# Altium project Control-Board-v1.0.PrjPcb (part 4 of 7)

## Sheet TFT_Display_Sheet.SchDoc
size 420 x 297 mm; SheetNumber: 6; SheetTotal: 9
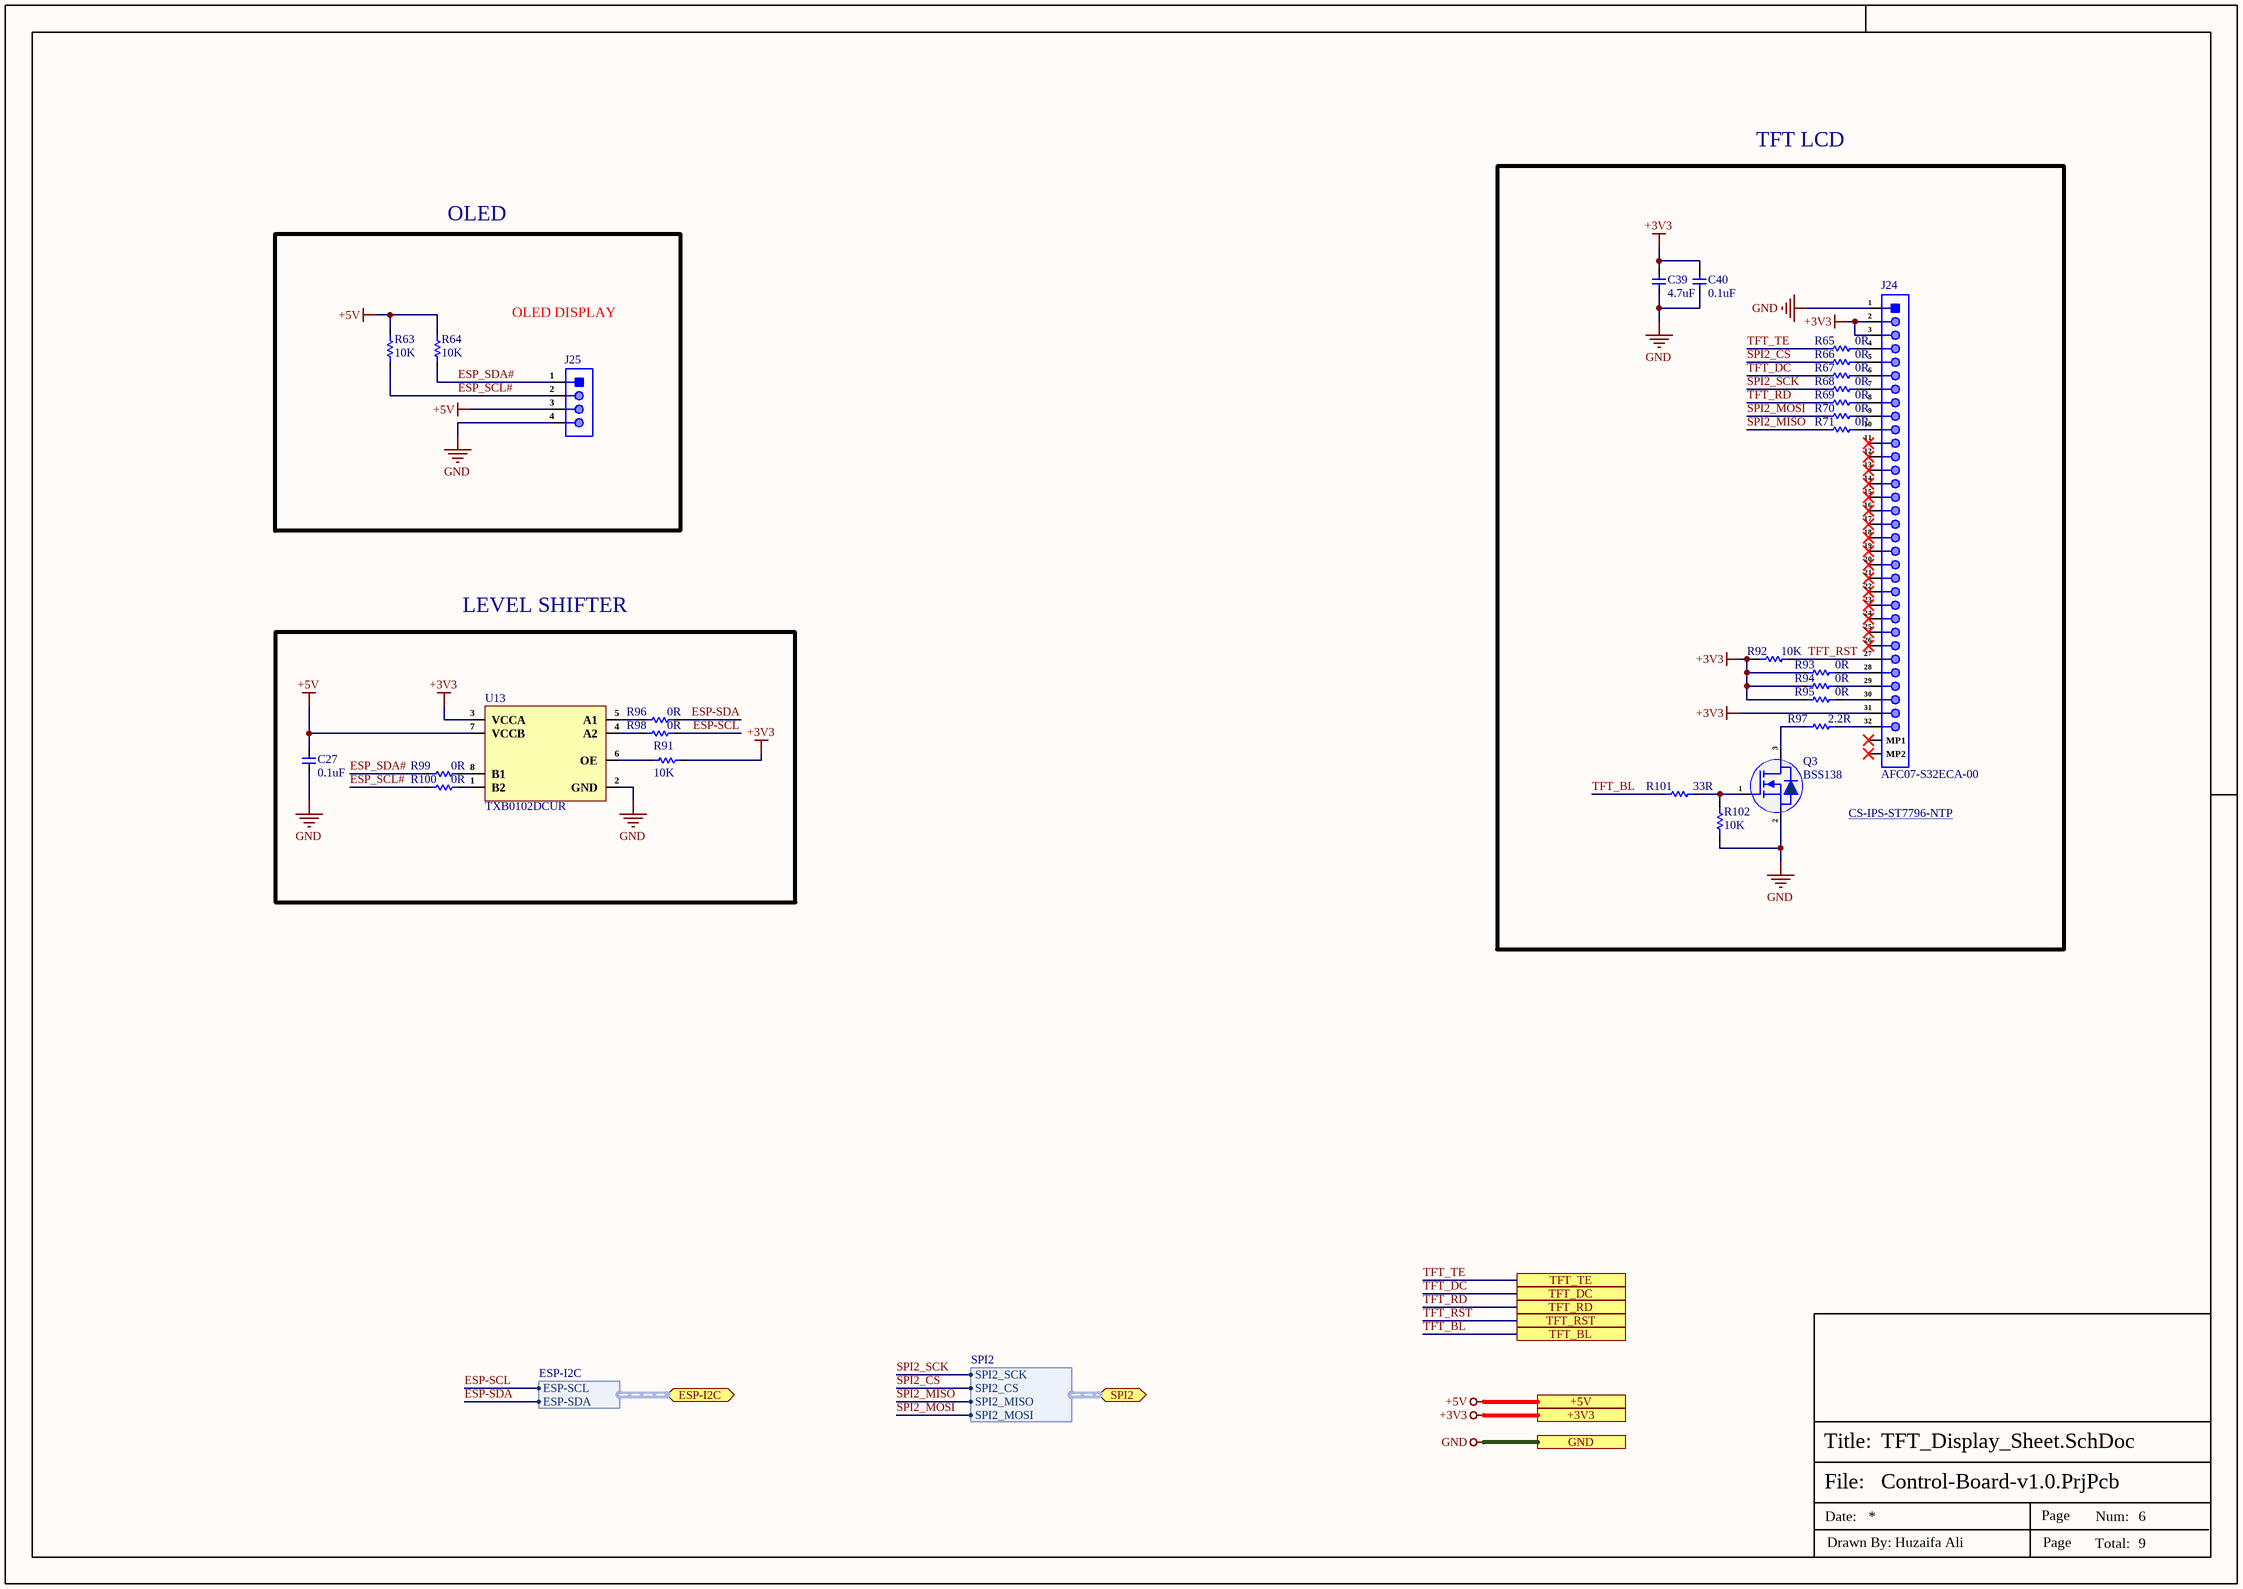
[diagram p5: TFT_Display_Sheet.SchDoc]

### Parts
C27  0.1uF  [Cap-0402]
C39  4.7uF  [Cap-0603]
C40  0.1uF  [Cap-0402]
J24  AFC07-S32ECA-00  [AFC07-S32ECA-00]
J25  B4B-XH-A(LF)(SN)  [B4B-XH-A(LF)(SN).]  (value not drawn)
Q3  BSS138  [Sot-23]
R63  10K  [Res-0402]
R64  10K  [Res-0402]
R65  0R  [Res-0402]
R66  0R  [Res-0402]
R67  0R  [Res-0402]
R68  0R  [Res-0402]
R69  0R  [Res-0402]
R70  0R  [Res-0402]
R71  0R  [Res-0402]
R91  10K  [Res-0402]
R92  10K  [Res-0402]
R93  0R  [Res-0402]
R94  0R  [Res-0402]
R95  0R  [Res-0402]
R96  0R  [Res-0402]
R97  2.2R  [Res-0603]
R98  0R  [Res-0402]
R99  0R  [Res-0402]
R100  0R  [Res-0402]
R101  33R  [Res-0402]
R102  10K  [Res-0402]
U13  TXB0102DCUR  [VSSOP-8(3.1x2.1)]

### Blocks framed on the sheet
CS-IPS-ST7796-NTP: C39 C40 J24 Q3 R65-R71 R92-R95 R97 R101 R102
OLED DISPLAY: J25 R63 R64

### Ports
+3V3 (see Top-Sheet[2B], CAN_Sheet[5D], ESP32_Sheet[5D], EtherCAT_Sheet[5D], Ethernet_Sheet[5D], Power_Sheet[5D], RS485_RS232_Sheet[5D], STM32_Sheet[5D]), +5V (see Top-Sheet[2B], CAN_Sheet[5D], Power_Sheet[5D], STM32_Sheet[5D]), ESP-I2C (bidir, harness ESP-I2C, see Top-Sheet[2B], ESP32_Sheet[4D]), GND (see Top-Sheet[2B], CAN_Sheet[5D], ESP32_Sheet[5D], EtherCAT_Sheet[5D], Ethernet_Sheet[5D], Power_Sheet[5D], RS485_RS232_Sheet[5D], STM32_Sheet[5D]), SPI2 (bidir, harness SPI2, see Top-Sheet[2B], STM32_Sheet[1C]), TFT_BL (see Top-Sheet[2C], STM32_Sheet[3D]), TFT_DC (see Top-Sheet[2C], STM32_Sheet[4D]), TFT_RD (see Top-Sheet[2C], STM32_Sheet[4D]), TFT_RST (see Top-Sheet[2C], STM32_Sheet[4D]), TFT_TE (see Top-Sheet[2B], STM32_Sheet[4D])

### Harnesses
ESP-I2C: ESP-SCL, ESP-SDA
SPI2: SPI2_SCK, SPI2_CS, SPI2_MISO, SPI2_MOSI

### Nets
+3V3: C39.2 C40.2 J24.2 J24.3 J24.31 R91.2 R92.2 R93.1 R94.1 R95.1 U13.3(VCCA) ; port +3V3
+5V: C27.2 J25.3 R63.2 R64.2 U13.7(VCCB) ; port +5V
GND: C27.1 C39.1 C40.1 J24.1 J25.4 Q3.2(S) R102.2 U13.2(GND) ; port GND
ESP-SCL: R98.2 ; port ESP-I2C.ESP-SCL
ESP-SDA: R96.2 ; port ESP-I2C.ESP-SDA
ESP_SCL#: J25.2 R63.1 R100.1
ESP_SDA#: J25.1 R64.1 R99.1
SPI2_CS: R66.1 ; port SPI2.SPI2_CS
SPI2_MISO: R71.1 ; port SPI2.SPI2_MISO
SPI2_MOSI: R70.1 ; port SPI2.SPI2_MOSI
SPI2_SCK: R68.1 ; port SPI2.SPI2_SCK
TFT_BL: R101.1 ; port TFT_BL
TFT_DC: R67.1 ; port TFT_DC
TFT_RD: R69.1 ; port TFT_RD
TFT_RST: J24.27 R92.1 ; port TFT_RST
TFT_TE: R65.1 ; port TFT_TE
NetJ24_4: J24.4 R65.2
NetJ24_5: J24.5 R66.2
NetJ24_6: J24.6 R67.2
NetJ24_7: J24.7 R68.2
NetJ24_8: J24.8 R69.2
NetJ24_9: J24.9 R70.2
NetJ24_10: J24.10 R71.2
NetJ24_28: J24.28 R93.2
NetJ24_29: J24.29 R94.2
NetJ24_30: J24.30 R95.2
NetJ24_32: J24.32 R97.2
NetQ3_1: Q3.1(G) R101.2 R102.1
NetQ3_3: Q3.3(D) R97.1
NetR91_1: R91.1 U13.6(OE)
NetR96_1: R96.1 U13.5(A1)
NetR98_1: R98.1 U13.4(A2)
NetR99_2: R99.2 U13.8(B1)
NetR100_2: R100.2 U13.1(B2)

Not connected (* = marked no-connect by the designer): J24 11* 12* 13* 14* 15* 16* 17* 18* 19* 20* 21* 22* 23* 24* 25* 26* MP1* MP2*

### Notes on the sheet
- TFT LCD
- OLED
- LEVEL SHIFTER
- File:
- Title:
- Date:
- Page
- Num:
- Total:
- Drawn By: Huzaifa Ali

### Library data of the parts
C27 = C1005X5R1H104K050BB: CAP CER 0.1UF 50V X5R 0402; Manufacturer: TDK; Dielectric Material: Ceramic; Capacitance: 100nF; Tolerance: 10%; Item Type: Capacitor; Supplier 1: Digi-Key; Manufacturer Part Number: C1005X5R1H104K050BB; Stock 1: 1455182; Pricing 1: 1=0.12, 10=0.09, 50=0.049, 100=0.04, 500=0.02858, 1000=0.02245, 2500=0.02041, 5000=0.01878 (USD); Mount: Surface Mount; Case/Package: 0402; Case Code (Metric): 1005; Case Code (Imperial): 0402; Weight: 2.3E-05oz; Min Operating Temperature: -55°C; Max Operating Temperature: 85°C; Dielectric: X5R; Voltage Rating: 50V; Packaging: Tape and Reel; Voltage Rating (DC): 50V; Termination: SMD/SMT; Construction: Flat; Package Quantity: 1; Resistor Type: Ceramic; Voltage: 50V; Series: C; Length: 1mm; Width: 0.02inch; Height: 0.5mm; Depth: 0.5mm; Thickness: 0.022inch; Radiation Hardening: No; Lead Free: Lead Free; REACH SVHC: No SVHC; RoHS Compliant: Yes; ComponentLink1URL: https://product.tdk.com/info/en/catalog/spec/mlccspec_commercial_general_midvoltage_en.pdf?src-supplier=Digi-Key; ComponentLink1Description: https://product.tdk.com/info/en/catalog/spec/mlccspec_commercial_general_midvoltage_en.pdf?src-supplier=Digi-Key; ComponentLink2URL: http://www.tdk.co.jp/tefe02/e413_c.pdf?src-supplier=Future+Electronics; ComponentLink2Description: http://www.tdk.co.jp/tefe02/e413_c.pdf?src-supplier=Future+Electronics; ComponentLink3URL: https://www.verical.com/server-webapp/html/getDatasheet?partID=743571&src-supplier=Verical; ComponentLink3Description: https://www.verical.com/server-webapp/html/getDatasheet?partID=743571&src-supplier=Verical; ComponentLink4URL: http://www.tdk.co.jp/tefe02/e412_c.pdf?src-supplier=Avnet+Europe; ComponentLink4Description: http://www.tdk.co.jp/tefe02/e412_c.pdf?src-supplier=Avnet+Europe; Supplier Part Number 1: 445-5942-1-ND; LCSC Part Number: C2181865
C39 = CC0603KRX5R7BB475: CAP CER 4.7UF 16V X5R 0603; Manufacturer: Yageo; Tolerance: 10%; Item Type: Capacitor; Supplier 1: Digi-Key; Manufacturer Part Number: CC0603KRX5R7BB475; RoHS: Yes; Category: Ceramic Capacitors; Stock 1: 547703; Pricing 1: 1=0.20000, 10=0.13800, 50=0.08280, 100=0.06990, 500=0.04784, 1000=0.04233 (USD); Mount: Surface Mount; Case/Package: 0603; Case Code (Imperial): 0603; Case Code (Metric): 1608; Weight: 7.1E-05oz; Min Operating Temperature: -55°C; Max Operating Temperature: 85°C; Capacitance: 4.7uF; Voltage Rating: 16V; Voltage Rating (DC): 16V; Packaging: Tape and Reel; Dielectric: X5R; Termination: SMD/SMT; Resistor Type: Ceramic; Series: CC; Length: 1.6mm; Width: 0.8mm; Height: 0.8mm; Thickness: 0.037inch; Depth: 0.8mm; Lead Free: Lead Free; Halogen Free: Halogen Free; RoHS Compliant: Yes; ComponentLink1URL: http://www.mouser.com/ds/2/447/UPY-GPHC_X5R_4V-to-50V_25-1131599.pdf?src-supplier=Mouser; ComponentLink1Description: http://www.mouser.com/ds/2/447/UPY-GPHC_X5R_4V-to-50V_25-1131599.pdf?src-supplier=Mouser; ComponentLink2URL: http://www.yageo.com/documents/recent/UPY-GPHC_X5R_4V-to-50V_25.pdf?src-supplier=Digi-Key; ComponentLink2Description: http://www.yageo.com/documents/recent/UPY-GPHC_X5R_4V-to-50V_25.pdf?src-supplier=Digi-Key; Supplier Part Number 1: 311-1785-1-ND; LCSC Part Number: C277476
C40 = CC0402JRX7R7BB104: CAP CER 0.1UF 16V X7R 0402; Manufacturer: Yageo; Material: 4241ConductorMaterial; Value: 100nF; Tolerance: 5%; Item Type: Capacitor; Supplier: Digikey; Supplier Part Number: 311-1676-1-ND; Manufacturer Part Number: CC0402JRX7R7BB104; RoHS: Yes; Category: Ceramic Capacitors; Stock: 1659111; Pricing: 1=0.1, 10=0.046, 50=0.0262, 100=0.0203, 500=0.01528, 1000=0.012, 2500=0.01091, 5000=0.01004 (USD); Mounting Technology: Surface Mount; Case/Package: 0402; Case Code (Metric): 1005; Case Code (Imperial): 0402; Min Operating Temperature: -55°C; Max Operating Temperature: 125°C; Dielectric: X7R; Packaging: Tape and Reel; Package Quantity: 10000; Voltage Rating (DC): 16V; Voltage Rating: 16V; Series: CC; Construction: Flat; Length: 0.039inch; Width: 0.02inch; Height: 0.5mm; Thickness: 0.022inch; Lead Free: Lead Free; Halogen Free: Halogen Free; RoHS Compliant: Yes; ComponentLink1URL: https://datasheet.ciiva.com/13210/upy-gphc-x7r-6-3v-to-50v-8-12304-13210152.pdf?src-supplier=Mouser; ComponentLink1Description: https://datasheet.ciiva.com/13210/upy-gphc-x7r-6-3v-to-50v-8-12304-13210152.pdf?src-supplier=Mouser; LCSC Part Number: C541464
J24 = AFC07-S32ECA-00: Slide Lock 32P Contact,Top Surface Mount，Right Angle 0.5mm SMD,P=0.5mm,Surface Mount，Right Angle FFC/FPC Connectors ROHS; Manufacturer: JUSHUO; Manufacturer Part Number: AFC07-S32ECA-00; Package: Custom; LCSC Part Number: C262646; Item Type: FFC/FPC Connector; ComponentLink1Description: LCSC; ComponentLink1URL: https://www.lcsc.com/product-detail/FFC-FPC-Connectors_JUSHUO-AFC07-S32ECA-00_C262646.html
J25 = B4B-XH-A(LF)(SN): CONN HEADER VERT 4POS 2.5MM; Manufacturer: JST; Current Rating: 3A; Gender: Male; Contact Resistance: 20mR; Voltage Rating (AC): 250V; Connector Type: Male Pin; Number of Positions: 4; Insulation Resistance: 1GR; Wire/Cable Gauge: 22AWG; Item Type: JST Connector; Supplier 1: Future Electronics; Manufacturer Part Number: B4B-XH-A(LF)(SN); RoHS: Yes; Category: FFC / FPC; Pricing 1: 1=0.13000, 300=0.11300, 1000=0.11000, 3000=0.10700, 10000=0.10400 (USD); Mount: Through Hole; Contact Material: Brass; Material: Polyamide; Contact Plating: Tin,Copper,Lead; Color: Natural; Housing Material: Polyamide; Housing Color: White; Min Operating Temperature: -25°C; Max Operating Temperature: 85°C; Number of Rows: 1; Max Current Rating: 3A; Package Quantity: 500; Packaging: Bulk; Voltage Rating: 250V; Termination: Press-Fit; Max Voltage Rating (AC): 250V; Max Voltage Rating (DC): 250V; Number of Contacts: 4; Orientation: Straight; Length: 12.4mm; Pitch: 2.5mm; Lead Pitch: 2.5mm; Depth: 5.75mm; REACH SVHC: No SVHC; Lead Free: Lead Free; ComponentLink1URL: https://datasheet.ciiva.com/26894/getdatasheetpartid-455616-26894787.pdf?src-supplier=Verical; ComponentLink1Description: https://datasheet.ciiva.com/26894/getdatasheetpartid-455616-26894787.pdf?src-supplier=Verical; ComponentLink2URL: https://datasheet.ciiva.com/26924/getdatasheetpartid-640571-26924035.pdf?src-supplier=Verical; ComponentLink2Description: https://datasheet.ciiva.com/26924/getdatasheetpartid-640571-26924035.pdf?src-supplier=Verical; ComponentLink3URL: https://datasheet.ciiva.com/16203/b4b-xh-alfsn-16203642.pdf?src-supplier=Future+Electronics; ComponentLink3Description: https://datasheet.ciiva.com/16203/b4b-xh-alfsn-16203642.pdf?src-supplier=Future+Electronics; ComponentLink4URL: https://datasheet.ciiva.com/726/exh-726404.pdf?src-supplier=Digi-Key; ComponentLink4Description: https://datasheet.ciiva.com/726/exh-726404.pdf?src-supplier=Digi-Key; Supplier Part Number 1: 8134090; LCSC Part Number: C144395
Q3 = BSS138: 50V 220mA 3.5Ω@10V,220mA 225mW 1.6V@1mA N Channel SOT-23 MOSFETs ROHS; Manufacturer: Slkor(SLKORMICRO Elec.); Item Type: Mosfet; Manufacturer Part Number: BSS138; Package: SOT-23; LCSC Part Number: C426569; ComponentLink1Description: LCSC; ComponentLink1URL: https://www.lcsc.com/product-detail/MOSFETs_Slkor-SLKORMICRO-Elec-BSS138_C426569.html
R63 R64 R91 R92 R102 = RC0402FR-0710KL: RES 10K OHM 1% 1/16W 0402; Manufacturer: Yageo; Resistance: 10kR; Voltage Rating (DC): 50V; Temperature Coefficient: 100ppm/°C; Power Rating: 62.5mW; Max Power Dissipation: 63mW; Item Type: Resistor; Supplier 1: Mouser; Manufacturer Part Number: RC0402FR-0710KL; RoHS: Yes; Category: Chip SMD Resistors; Stock 1: 18648329; Pricing 1: 1=0.10000, 10=0.01400, 50=0.01400, 100=0.00500, 1000=0.00300, 10000=0.00200 (USD); Case/Package: 0402; Number of Pins: 2; Case Code (Imperial): 0402; Case Code (Metric): 1005; Min Operating Temperature: -55°C; Max Operating Temperature: 155°C; Resistor Type: Thick Film; Tolerance: 1%; Packaging: Tape and Reel; Voltage Rating: 50V; Termination: SMD/SMT; Working Voltage: 50V; Number of Terminations: 2; Features: Moisture Resistant; Series: RC; Resistance Tolerance: 1%; Construction: Rectangular; Length: 1mm; Width: 0.5mm; Height: 0.32mm; Depth: 0.5mm; Lead Pitch: 0.2mm; REACH SVHC: No SVHC; Lead Free: Lead Free; RoHS Compliant: Yes; Military Standard: Not; ComponentLink1URL: https://datasheet.ciiva.com/7660/38568-7660787.pdf?src-supplier=Element14; ComponentLink1Description: https://datasheet.ciiva.com/7660/38568-7660787.pdf?src-supplier=Element14; ComponentLink2URL: https://datasheet.ciiva.com/7849/1686128-7849814.pdf?src-supplier=Element14; ComponentLink2Description: https://datasheet.ciiva.com/7849/1686128-7849814.pdf?src-supplier=Element14; ComponentLink3URL: https://datasheet.ciiva.com/7983/1018594-7983486.pdf?src-supplier=Element14; ComponentLink3Description: https://datasheet.ciiva.com/7983/1018594-7983486.pdf?src-supplier=Element14; ComponentLink4URL: https://datasheet.ciiva.com/22747/1018594-22747512.pdf?src-supplier=Element14; ComponentLink4Description: https://datasheet.ciiva.com/22747/1018594-22747512.pdf?src-supplier=Element14; ComponentLink5URL: https://datasheet.ciiva.com/12667/pyu-rc0402-51-rohs-l-6-r-12667067.pdf?src-supplier=Mouser; ComponentLink5Description: https://datasheet.ciiva.com/12667/pyu-rc0402-51-rohs-l-6-r-12667067.pdf?src-supplier=Mouser; ComponentLink6URL: https://datasheet.ciiva.com/7849/1784430-7849813.pdf?src-supplier=Element14; ComponentLink6Description: https://datasheet.ciiva.com/7849/1784430-7849813.pdf?src-supplier=Element14; ComponentLink7URL: https://datasheet.ciiva.com/7849/1784430-7849815.pdf?src-supplier=Element14; ComponentLink7Description: https://datasheet.ciiva.com/7849/1784430-7849815.pdf?src-supplier=Element14; Supplier Part Number 1: 603-RC0402FR-0710KL; LCSC Part Number: C60490
R65-R71 R93-R96 R98-R100 = RC0402FR-070RL: RES 0 OHM JUMPER 1/16W 0402; Manufacturer: Yageo; Item Type: Resistors; Tolerance: 1%; Power Rating: 62.5mW; Voltage Rating: 50V; Temperature Coefficient: 200ppm/°C; Max Power Dissipation: 63mW; Supplier 1: Mouser; Manufacturer Part Number: RC0402FR-070RL; RoHS: Yes; Stock 1: 8556842; Pricing 1: 1=0.10000, 10=0.01400, 50=0.01400, 100=0.00600, 1000=0.00300, 5000=0.00200, 10000=0.00100 (USD); Mount: Surface Mount; Case/Package: 0402; Contact Plating: Tin,Matte; Case Code (Imperial): 0402; Case Code (Metric): 1005; Size Code: 0402; Min Operating Temperature: -55°C; Max Operating Temperature: 155°C; Resistance: 0R; Resistor Type: Thick Film; Packaging: Tape and Reel; Termination: SMD/SMT; Features: Moisture Resistant; Series: RC; Number of Terminations: 2; Length: 1mm; Width: 0.5mm; Height: 0.35mm; Radiation Hardening: No; Lead Free: Lead Free; RoHS Compliant: Yes; ComponentLink1URL: https://datasheet.ciiva.com/8896/pyu-rc0402-51-rohs-l-6-8896149.pdf?src-supplier=Avnet; ComponentLink1Description: https://datasheet.ciiva.com/8896/pyu-rc0402-51-rohs-l-6-8896149.pdf?src-supplier=Avnet; ComponentLink2URL: https://datasheet.ciiva.com/16790/pyu-rc0402-51-rohs-l-6-r-16790444.pdf?src-supplier=Future+Electronics; ComponentLink2Description: https://datasheet.ciiva.com/16790/pyu-rc0402-51-rohs-l-6-r-16790444.pdf?src-supplier=Future+Electronics; Supplier Part Number 1: 603-RC0402FR-070RL; LCSC Part Number: C106231
R97 = RC0603FR-072R2L: RES 2.2 OHM 1% 1/10W 0603; Manufacturer: Yageo; Item Type: Resistors; Voltage Rating: 50V; Power Rating: 100mW; Temperature Coefficient: 200ppm/°C; Supplier: Digikey; LCSC Part Number: C112307; Manufacturer Part Number: RC0603FR-072R2L; RoHS: Yes; Stock: 331140; Pricing: 1=0.1, 10=0.029, 50=0.0188, 100=0.0158, 500=0.01094, 1000=0.00947 (USD); Case/Package: 0603; Pins: 2; Case Code (Metric): 1608; Case Code (Imperial): 0603; Min Operating Temperature: -55°C; Max Operating Temperature: 155°C; Voltage Rating (DC): 50V; Package Quantity: 1; Value: 2.2R; Tolerance: 1%; Packaging: Tape and Reel; Resistor Type: Thick Film; Number of Terminations: 2; Termination: SMD/SMT; Max Power Dissipation: 100mW; Features: Moisture Resistant; Series: RC; Technology: THICK FILM; Resistance Tolerance: 1%; Length: 0.063inch; Width: 0.031inch; Height: 0.022inch; Depth: 0.8mm; Reach SVHC Compliant: No; Lead Free: Lead Free; RoHS Compliant: Yes; ComponentLink1URL: https://datasheet.ciiva.com/11808/0900766b80f96399-11808160.pdf?src-supplier=Rs; ComponentLink1Description: https://datasheet.ciiva.com/11808/0900766b80f96399-11808160.pdf?src-supplier=Rs; ComponentLink2URL: https://datasheet.ciiva.com/2554/pyu-r-int-thick-7-2554421.pdf?src-supplier=Digikey; ComponentLink2Description: https://datasheet.ciiva.com/2554/pyu-r-int-thick-7-2554421.pdf?src-supplier=Digikey; ComponentLink3URL: https://datasheet.ciiva.com/2554/pyu-r-int-thick-7-2554422.pdf?src-supplier=Digikey; ComponentLink3Description: https://datasheet.ciiva.com/2554/pyu-r-int-thick-7-2554422.pdf?src-supplier=Digikey; ComponentLink4URL: https://datasheet.ciiva.com/2554/pyu-r-int-thick-7-2554420.pdf?src-supplier=Digikey; ComponentLink4Description: https://datasheet.ciiva.com/2554/pyu-r-int-thick-7-2554420.pdf?src-supplier=Digikey
R101 = RC0402FR-0733RL: RES 33 OHM 1% 1/16W 0402; Manufacturer: Yageo; Power Rating: 62.5mW; Voltage Rating: 50V; Temperature Coefficient: 100ppm/°C; Max Power Dissipation: 63mW; Supplier 1: Mouser; Manufacturer Part Number: RC0402FR-0733RL; RoHS: Yes; Category: Chip SMD Resistors; Stock 1: 1843488; Pricing 1: 1=0.10000, 10=0.01200, 50=0.01200, 100=0.00500, 1000=0.00300, 10000=0.00100 (USD); Case/Package: 0402; Number of Pins: 2; Case Code (Imperial): 0402; Case Code (Metric): 1005; Size Code: 0402; Min Operating Temperature: -55°C; Max Operating Temperature: 155°C; Resistor Type: Thick Film; Resistance: 33R; Tolerance: 1%; Packaging: Tape and Reel; Voltage Rating (DC): 50V; Package Quantity: 10000; Termination: SMD/SMT; Features: Moisture Resistant; Series: RC; Number of Terminations: 2; Resistance Tolerance: 1%; Construction: Rectangular; Technology: THICK FILM; Length: 1mm; Width: 0.5mm; Height: 0.35mm; Depth: 0.5mm; RoHS Compliant: Yes; REACH SVHC: Unknown; Military Standard: Not; Lead Free: Lead Free; ComponentLink1URL: https://datasheet.ciiva.com/11819/0900766b80c66297-11819487.pdf?src-supplier=RSComponents; ComponentLink1Description: https://datasheet.ciiva.com/11819/0900766b80c66297-11819487.pdf?src-supplier=RSComponents; ComponentLink2URL: https://datasheet.ciiva.com/24070/pyu-rc0402-51-rohs-l-6-r-8721-24070077.pdf?src-supplier=Mouser; ComponentLink2Description: https://datasheet.ciiva.com/24070/pyu-rc0402-51-rohs-l-6-r-8721-24070077.pdf?src-supplier=Mouser; ComponentLink3URL: https://datasheet.ciiva.com/7849/1018594-7849967.pdf?src-supplier=Element14; ComponentLink3Description: https://datasheet.ciiva.com/7849/1018594-7849967.pdf?src-supplier=Element14; ComponentLink4URL: https://datasheet.ciiva.com/7849/1018594-7849966.pdf?src-supplier=Element14; ComponentLink4Description: https://datasheet.ciiva.com/7849/1018594-7849966.pdf?src-supplier=Element14; ComponentLink5URL: https://datasheet.ciiva.com/15189/getdatasheetpartid-329253-15189431.pdf?src-supplier=Verical; ComponentLink5Description: https://datasheet.ciiva.com/15189/getdatasheetpartid-329253-15189431.pdf?src-supplier=Verical; ComponentLink6URL: https://datasheet.ciiva.com/17070/pyu-rc0402-51-rohs-l-6-r-17070335.pdf?src-supplier=Future+Electronics; ComponentLink6Description: https://datasheet.ciiva.com/17070/pyu-rc0402-51-rohs-l-6-r-17070335.pdf?src-supplier=Future+Electronics; Supplier Part Number 1: 603-RC0402FR-0733RL; LCSC Part Number: C138002
U13 = TXB0102DCUR: IC TRANSLTR BIDIRECTIONAL 8VSSOP; Manufacturer: Texas Instruments; Number of Circuits: 1; Nominal Supply Current: 3.5uA; Number of Inputs: 1NUMBER; Max Supply Voltage: 5.5V; Min Supply Voltage: 1.2V; Propagation Delay: 7.4ns; Data Rate: 100Mbps; Logic Function: Translator; Number of Bits: 2; Turn-On Delay Time: 31ns; High Level Output Current: -20uA; Low Level Output Current: 20uA; Output Type: 3-STATE; Supplier: Digikey; Supplier Part Number: 296-22862-1-ND; Manufacturer Part Number: TXB0102DCUR; RoHS: Yes; Category: Voltage Level Shifters; Stock: 10593; Pricing: 1=0.69, 10=0.606, 25=0.5696, 100=0.4649, 250=0.4318, 500=0.36748, 1000=0.29398 (USD); Mounting Technology: Surface Mount; Case/Package: VSSOP; Pins: 8; Weight: 0.000339oz; Min Operating Temperature: -40°C; Max Operating Temperature: 85°C; Number of Outputs: 1NUMBER; Packaging: Tape and Reel; Package Quantity: 3000; Series: -; Channel Type: Bidirectional; Length: 2.3mm; Width: 2mm; Height: 900um; Thickness: 850um; Radiation Hardening: No; Reach SVHC Compliant: No; Lead Free: Lead Free; RoHS Compliant: Yes; ComponentLink1URL: https://datasheet.ciiva.com/7744/1634161-7744195.pdf?src-supplier=Element14; ComponentLink1Description: https://datasheet.ciiva.com/7744/1634161-7744195.pdf?src-supplier=Element14; ComponentLink2URL: https://datasheet.ciiva.com/22677/1699360-22677930.pdf?src-supplier=Element14; ComponentLink2Description: https://datasheet.ciiva.com/22677/1699360-22677930.pdf?src-supplier=Element14; ComponentLink3URL: https://datasheet.ciiva.com/4226/sces641b-4226960.pdf?src-supplier=Arrow+Electronics; ComponentLink3Description: https://datasheet.ciiva.com/4226/sces641b-4226960.pdf?src-supplier=Arrow+Electronics; ComponentLink4URL: https://datasheet.ciiva.com/15096/getdatasheetpartid-214907-15096235.pdf?src-supplier=Verical; ComponentLink4Description: https://datasheet.ciiva.com/15096/getdatasheetpartid-214907-15096235.pdf?src-supplier=Verical; ComponentLink5URL: https://datasheet.ciiva.com/6132/txb0102-6132717.pdf?src-supplier=Farnell; ComponentLink5Description: https://datasheet.ciiva.com/6132/txb0102-6132717.pdf?src-supplier=Farnell; ComponentLink6URL: https://datasheet.ciiva.com/46384/1874809-46384198.pdf?src-supplier=Element14; ComponentLink6Description: https://datasheet.ciiva.com/46384/1874809-46384198.pdf?src-supplier=Element14; ComponentLink7URL: https://datasheet.ciiva.com/1899/txb0102-1899430.pdf?src-supplier=Digikey; ComponentLink7Description: https://datasheet.ciiva.com/1899/txb0102-1899430.pdf?src-supplier=Digikey; ComponentLink8URL: https://datasheet.ciiva.com/1899/txb0102-1899429.pdf?src-supplier=Digikey; ComponentLink8Description: https://datasheet.ciiva.com/1899/txb0102-1899429.pdf?src-supplier=Digikey; ComponentLink9URL: https://datasheet.ciiva.com/1899/txb0102-1899431.pdf?src-supplier=Digikey; ComponentLink9Description: https://datasheet.ciiva.com/1899/txb0102-1899431.pdf?src-supplier=Digikey; ComponentLink10URL: https://datasheet.ciiva.com/14287/txb0102-14287496.pdf?src-supplier=Avnet; ComponentLink10Description: https://datasheet.ciiva.com/14287/txb0102-14287496.pdf?src-supplier=Avnet; LCSC Part Number: C60709; Type: IC; ComponentLink11Description: LCSC; ComponentLink11URL: https://www.lcsc.com/product-detail/Translators-Level-Shifters_Texas-Instruments-TXB0102DCUR_C60709.html

## Sheet STM32_Sheet.SchDoc
size 420 x 297 mm; SheetNumber: 4; SheetTotal: 9
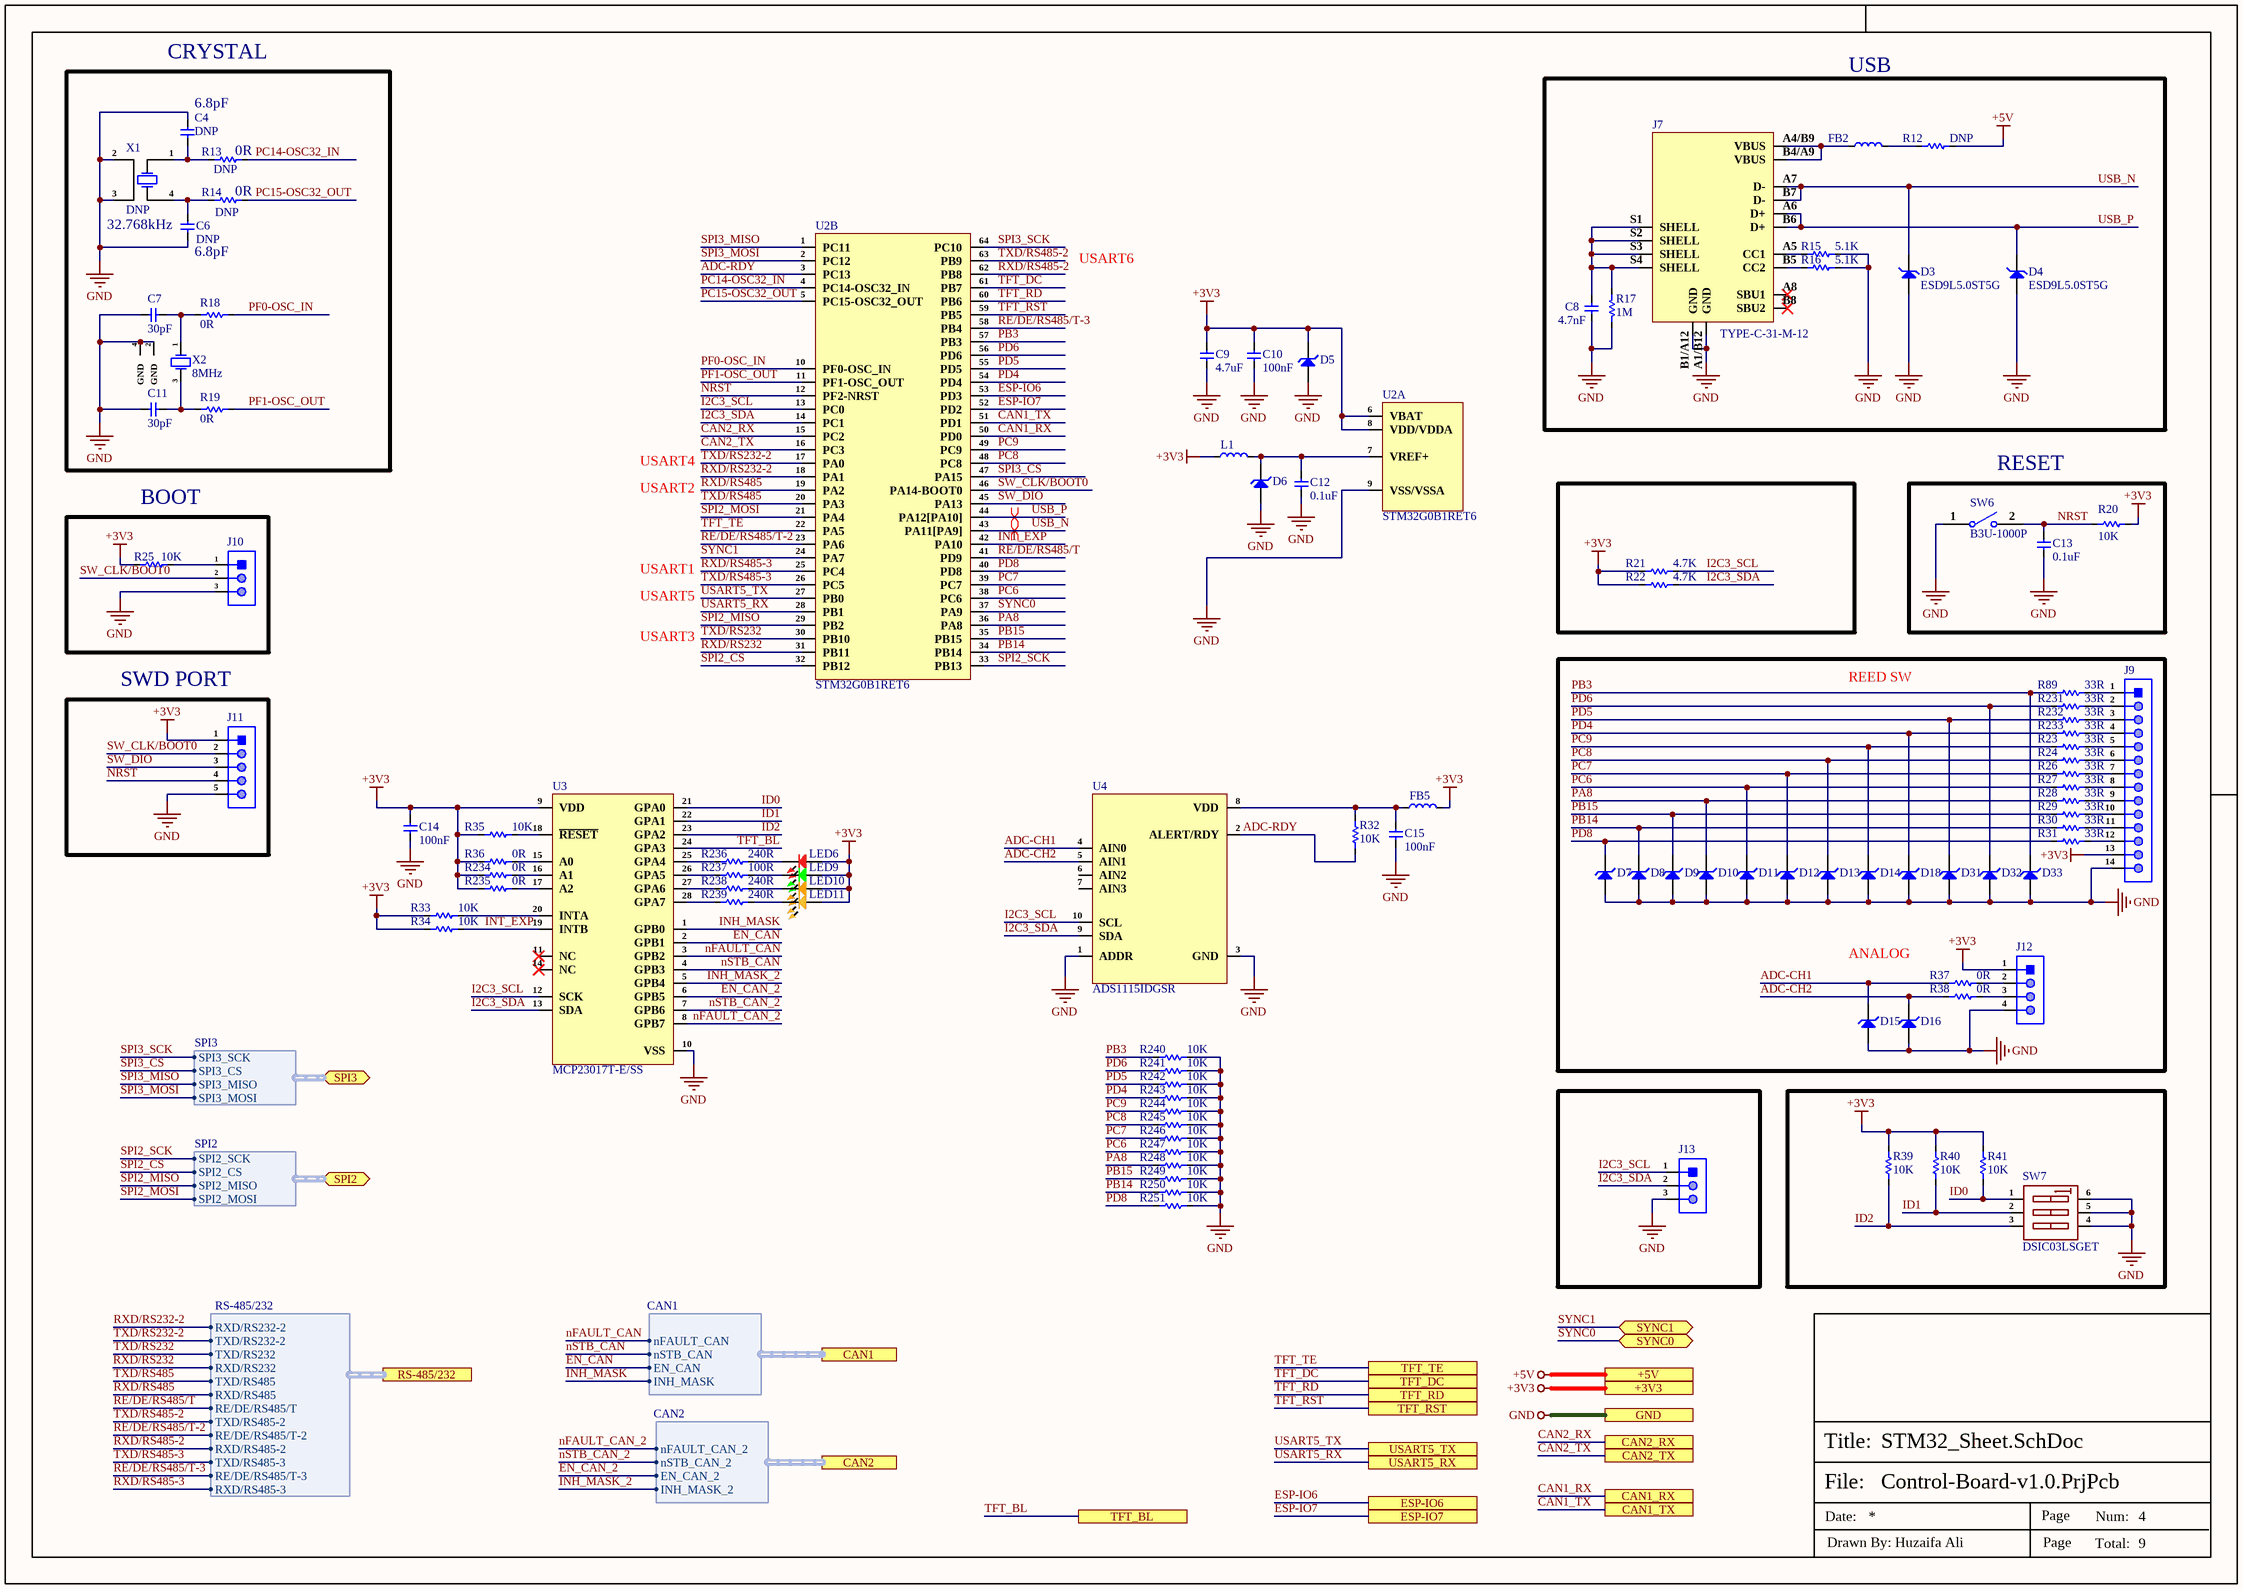
[diagram p6: STM32_Sheet.SchDoc]

### Parts
C4  DNP  [Cap-0402]
C6  DNP  [Cap-0402]
C7  30pF  [Cap-0402]
C8  4.7nF  [Cap-0603]
C9  4.7uF  [Cap-0402]
C10  100nF  [cap-0402]
C11  30pF  [Cap-0402]
C12  0.1uF  [Cap-0402]
C13  0.1uF  [Cap-0402]
C14  100nF  [cap-0402]
C15  100nF  [cap-0402]
D3  ESD9L5.0ST5G  [SOD-923.]
D4  ESD9L5.0ST5G  [SOD-923.]
D5  SD03  [SOD-323]  (value not drawn)
D6  SD03  [SOD-323]  (value not drawn)
D7  MM3Z3V3  [SOD-323]  (value not drawn)
D8  MM3Z3V3  [SOD-323]  (value not drawn)
D9  MM3Z3V3  [SOD-323]  (value not drawn)
D10  MM3Z3V3  [SOD-323]  (value not drawn)
D11  MM3Z3V3  [SOD-323]  (value not drawn)
D12  MM3Z3V3  [SOD-323]  (value not drawn)
D13  MM3Z3V3  [SOD-323]  (value not drawn)
D14  MM3Z3V3  [SOD-323]  (value not drawn)
D15  MM3Z3V3  [SOD-323]  (value not drawn)
D16  MM3Z3V3  [SOD-323]  (value not drawn)
D18  MM3Z3V3  [SOD-323]  (value not drawn)
D31  MM3Z3V3  [SOD-323]  (value not drawn)
D32  MM3Z3V3  [SOD-323]  (value not drawn)
D33  MM3Z3V3  [SOD-323]  (value not drawn)
FB2  BLM18PG221SN1D  [IND-0603 (1608 Metric)]  (value not drawn)
FB5  BLM18PG221SN1D  [IND-0603 (1608 Metric)]  (value not drawn)
J7  TYPE-C-31-M-12  [TYPE-C-31-M-12_]
J9  X6511WV-14H-C60D30  [HDR 1x14 TH Male]  (value not drawn)
J10  68000-103HLF  [HDR1X3_]  (value not drawn)
J11  X6511WV-05H-C60D30  [HDR1X5_]  (value not drawn)
J12  X6511WV-04H-C60D30  [HDR1X4_]  (value not drawn)
J13  B3B-XH-A(LF)(SN)  [B3B-XH-A(LF)(SN)_]  (value not drawn)
L1  BLM15AG601SN1D  [IND-0402]  (value not drawn)
LED6  RED  [LED-0603]  (value not drawn)
LED9  Emerald  [LED-0603]  (value not drawn)
LED10  NCD0603O2  [LED-0603]  (value not drawn)
LED11  Yellow  [LED-0603]  (value not drawn)
R12  DNP  [Res-0402]
R13  DNP  [Res-0603]
R14  DNP  [Res-0603]
R15  5.1K  [Res-0402]
R16  5.1K  [Res-0402]
R17  1M  [Res-0402]
R18  0R  [Res-0603]
R19  0R  [Res-0603]
R20  10K  [Res-0402]
R21  4.7K  [Res-0402]
R22  4.7K  [Res-0402]
R23  33R  [Res-0402]
R24  33R  [Res-0402]
R25  10K  [Res-0402]
R26  33R  [Res-0402]
R27  33R  [Res-0402]
R28  33R  [Res-0402]
R29  33R  [Res-0402]
R30  33R  [Res-0402]
R31  33R  [Res-0402]
R32  10K  [Res-0402]
R33  10K  [Res-0402]
R34  10K  [Res-0402]
R35  10K  [Res-0402]
R36  0R  [Res-0402]
R37  0R  [Res-0402]
R38  0R  [Res-0402]
R39  10K  [Res-0402]
R40  10K  [Res-0402]
R41  10K  [Res-0402]
R89  33R  [Res-0402]
R231  33R  [Res-0402]
R232  33R  [Res-0402]
R233  33R  [Res-0402]
R234  0R  [Res-0402]
R235  0R  [Res-0402]
R236  240R  [Res-0402]
R237  100R  [Res-0402]
R238  240R  [Res-0402]
R239  240R  [Res-0402]
R240  10K  [Res-0402]
R241  10K  [Res-0402]
R242  10K  [Res-0402]
R243  10K  [Res-0402]
R244  10K  [Res-0402]
R245  10K  [Res-0402]
R246  10K  [Res-0402]
R247  10K  [Res-0402]
R248  10K  [Res-0402]
R249  10K  [Res-0402]
R250  10K  [Res-0402]
R251  10K  [Res-0402]
SW6  B3U-1000P  [B3U-1000P]
SW7  DSIC03LSGET  [DSIC03LSGET]
U2  STM32G0B1RET6  [LQFP-64(10x10)]  (parts A,B of 2)
U3  MCP23017T-E/SS  [SSOP-28-208mil]
U4  ADS1115IDGSR  [VSSOP-10]
X1  DNP  [MC-306]
X2  8MHz  [5TJ480000XYLBC_]

### Blocks framed on the sheet
CRYSTAL: C4 C6 C7 C11 R13 R14 R18 R19 X1 X2
USB: C8 D3 D4 FB2 J7 R12 R15-R17
BOOT: J10 R25
RESET: C13 R20 SW6
SWD PORT: J11

### Ports
+3V3 (see Top-Sheet[4A], CAN_Sheet[5D], ESP32_Sheet[5D], EtherCAT_Sheet[5D], Ethernet_Sheet[5D], Power_Sheet[5D], RS485_RS232_Sheet[5D], TFT_Display_Sheet[5D]), +5V (see Top-Sheet[4A], CAN_Sheet[5D], Power_Sheet[5D], TFT_Display_Sheet[5D]), CAN1 (harness CAN1, see Top-Sheet[4B], CAN_Sheet[3D]), CAN1_RX (see Top-Sheet[4B], CAN_Sheet[2D]), CAN1_TX (see Top-Sheet[4B], CAN_Sheet[2D]), CAN2 (harness CAN2, see Top-Sheet[4B], CAN_Sheet[3D]), CAN2_RX (see Top-Sheet[4B], CAN_Sheet[2D]), CAN2_TX (see Top-Sheet[4B], CAN_Sheet[2D]), ESP-IO6 (see Top-Sheet[4B], ESP32_Sheet[3D]), ESP-IO7 (see Top-Sheet[4B], ESP32_Sheet[3D]), GND (see Top-Sheet[4B], CAN_Sheet[5D], ESP32_Sheet[5D], EtherCAT_Sheet[5D], Ethernet_Sheet[5D], Power_Sheet[5D], RS485_RS232_Sheet[5D], TFT_Display_Sheet[5D]), RS-485/232 (harness RS-485/232, see Top-Sheet[4B], RS485_RS232_Sheet[2D]), SPI2 (bidir, harness SPI2, see Top-Sheet[4B], TFT_Display_Sheet[3D]), SPI3 (bidir, harness SPI3, see Top-Sheet[4C], EtherCAT_Sheet[1D]), SYNC0 (bidir, see Top-Sheet[4C], EtherCAT_Sheet[5D]), SYNC1 (bidir, see Top-Sheet[4C], EtherCAT_Sheet[5D]), TFT_BL (see Top-Sheet[4C], TFT_Display_Sheet[5D]), TFT_DC (see Top-Sheet[4C], TFT_Display_Sheet[5D]), TFT_RD (see Top-Sheet[4C], TFT_Display_Sheet[5D]), TFT_RST (see Top-Sheet[4C], TFT_Display_Sheet[5D]), TFT_TE (see Top-Sheet[4B], TFT_Display_Sheet[5D]), USART5_RX (see Top-Sheet[4B], ESP32_Sheet[3D]), USART5_TX (see Top-Sheet[4B], ESP32_Sheet[3D])

### Harnesses
CAN1: nFAULT_CAN, nSTB_CAN, EN_CAN, INH_MASK
CAN2: nFAULT_CAN_2, nSTB_CAN_2, EN_CAN_2, INH_MASK_2
SPI3: SPI3_SCK, SPI3_CS, SPI3_MISO, SPI3_MOSI
SPI2: SPI2_SCK, SPI2_CS, SPI2_MISO, SPI2_MOSI
RS-485/232: TXD/RS232, RXD/RS232, TXD/RS485, RXD/RS485, RE/DE/RS485/T, TXD/RS485-2, RE/DE/RS485/T-2, RXD/RS485-2, TXD/RS232-2, RXD/RS232-2, TXD/RS485-3, RE/DE/RS485/T-3, RXD/RS485-3

### Nets
+3V3: C9.2 C10.2 C14.2 D5.1(K) FB5.2 J9.13 J11.1 J12.1 L1.1 LED6.1 LED9.1 LED10.1 LED11.1 R20.2 R21.2 R22.2 R25.2 R33.2 R34.2 R35.2 R36.1 R39.2 R40.2 R41.2 R234.1 R235.1 U2.6(VBAT) U2.8(VDD/VDDA) U3.9(VDD) ; port +3V3
+5V: R12.2 ; port +5V
GND: C4.1 C6.2 C7.1 C8.1 C9.1 C10.1 C11.1 C12.1 C13.1 C14.1 C15.2 D3.2(A) D4.2(A) D5.2(A) D6.2(A) D7.2(A) D8.2(A) D9.2(A) D10.2(A) D11.2(A) D12.2(A) D13.2(A) D14.2(A) D15.2(A) D16.2(A) D18.2(A) D31.2(A) D32.2(A) D33.2(A) J7.A1/B12(GND) J7.B1/A12(GND) J9.14 J10.3 J11.5 J12.4 J13.3 R15.2 R16.2 R17.2 R240.1 R241.1 R242.1 R243.1 R244.1 R245.1 R246.1 R247.1 R248.1 R249.1 R250.1 R251.1 SW6.1 SW7.4(B3) SW7.5(B2) SW7.6(B1) U2.9(VSS/VSSA) U3.10(VSS) U4.1(ADDR) U4.3(GND) X1.2 X1.3 X2.2(GND) X2.4(GND) ; port GND
ADC-CH1: D15.1(K) R37.1 U4.4(AIN0)
ADC-CH2: D16.1(K) R38.1 U4.5(AIN1)
ADC-RDY: R32.2 U2.3(PC13) U4.2(ALERT/RDY)
CAN1_RX: U2.50(PD0) ; port CAN1_RX
CAN1_TX: U2.51(PD1) ; port CAN1_TX
CAN2_RX: U2.15(PC2) ; port CAN2_RX
CAN2_TX: U2.16(PC3) ; port CAN2_TX
EN_CAN: U3.2(GPB1) ; port CAN1.EN_CAN
EN_CAN_2: U3.6(GPB5) ; port CAN2.EN_CAN_2
ESP-IO6: U2.53(PD3) ; port ESP-IO6
ESP-IO7: U2.52(PD2) ; port ESP-IO7
I2C3_SCL: J13.1 R21.1 U2.13(PC0) U3.12(SCK) U4.10(SCL)
I2C3_SDA: J13.2 R22.1 U2.14(PC1) U3.13(SDA) U4.9(SDA)
ID0: R41.1 SW7.1(A1) U3.21(GPA0)
ID1: R40.1 SW7.2(A2) U3.22(GPA1)
ID2: R39.1 SW7.3(A3) U3.23(GPA2)
INH_MASK: U3.1(GPB0) ; port CAN1.INH_MASK
INH_MASK_2: U3.5(GPB4) ; port CAN2.INH_MASK_2
INT_EXP: R34.1 U2.42(PA10) U3.19(INTB)
nFAULT_CAN: U3.3(GPB2) ; port CAN1.nFAULT_CAN
nFAULT_CAN_2: U3.8(GPB7) ; port CAN2.nFAULT_CAN_2
NRST: C13.2 J11.4 R20.1 SW6.2 U2.12(PF2-NRST)
nSTB_CAN: U3.4(GPB3) ; port CAN1.nSTB_CAN
nSTB_CAN_2: U3.7(GPB6) ; port CAN2.nSTB_CAN_2
PA8: D10.1(K) R28.1 R248.2 U2.36(PA8)
PB3: D33.1(K) R89.1 R240.2 U2.57(PB3)
PB14: D8.1(K) R30.1 R250.2 U2.34(PB14)
PB15: D9.1(K) R29.1 R249.2 U2.35(PB15)
PC6: D11.1(K) R27.1 R247.2 U2.38(PC6)
PC7: D12.1(K) R26.1 R246.2 U2.39(PC7)
PC8: D13.1(K) R24.1 R245.2 U2.48(PC8)
PC9: D14.1(K) R23.1 R244.2 U2.49(PC9)
PC14-OSC32_IN: R13.2 U2.4(PC14-OSC32_IN)
PC15-OSC32_OUT: R14.2 U2.5(PC15-OSC32_OUT)
PD4: D18.1(K) R233.1 R243.2 U2.54(PD4)
PD5: D31.1(K) R232.1 R242.2 U2.55(PD5)
PD6: D32.1(K) R231.1 R241.2 U2.56(PD6)
PD8: D7.1(K) R31.1 R251.2 U2.40(PD8)
PF0-OSC_IN: R18.2 U2.10(PF0-OSC_IN)
PF1-OSC_OUT: R19.2 U2.11(PF1-OSC_OUT)
RE/DE/RS485/T: U2.41(PD9) ; port RS-485/232.RE/DE/RS485/T
RE/DE/RS485/T-2: U2.23(PA6) ; port RS-485/232.RE/DE/RS485/T-2
RE/DE/RS485/T-3: U2.58(PB4) ; port RS-485/232.RE/DE/RS485/T-3
RXD/RS232: U2.31(PB11) ; port RS-485/232.RXD/RS232
RXD/RS232-2: U2.18(PA1) ; port RS-485/232.RXD/RS232-2
RXD/RS485: U2.19(PA2) ; port RS-485/232.RXD/RS485
RXD/RS485-2: U2.62(PB8) ; port RS-485/232.RXD/RS485-2
RXD/RS485-3: U2.25(PC4) ; port RS-485/232.RXD/RS485-3
SPI2_CS: U2.32(PB12) ; port SPI2.SPI2_CS
SPI2_MISO: U2.29(PB2) ; port SPI2.SPI2_MISO
SPI2_MOSI: U2.21(PA4) ; port SPI2.SPI2_MOSI
SPI2_SCK: U2.33(PB13) ; port SPI2.SPI2_SCK
SPI3_CS: U2.47(PA15) ; port SPI3.SPI3_CS
SPI3_MISO: U2.1(PC11) ; port SPI3.SPI3_MISO
SPI3_MOSI: U2.2(PC12) ; port SPI3.SPI3_MOSI
SPI3_SCK: U2.64(PC10) ; port SPI3.SPI3_SCK
SW_CLK/BOOT0: J10.2 J11.2 U2.46(PA14-BOOT0)
SW_DIO: J11.3 U2.45(PA13)
SYNC0: U2.37(PA9) ; port SYNC0
SYNC1: U2.24(PA7) ; port SYNC1
TFT_BL: U3.24(GPA3) ; port TFT_BL
TFT_DC: U2.61(PB7) ; port TFT_DC
TFT_RD: U2.60(PB6) ; port TFT_RD
TFT_RST: U2.59(PB5) ; port TFT_RST
TFT_TE: U2.22(PA5) ; port TFT_TE
TXD/RS232: U2.30(PB10) ; port RS-485/232.TXD/RS232
TXD/RS232-2: U2.17(PA0) ; port RS-485/232.TXD/RS232-2
TXD/RS485: U2.20(PA3) ; port RS-485/232.TXD/RS485
TXD/RS485-2: U2.63(PB9) ; port RS-485/232.TXD/RS485-2
TXD/RS485-3: U2.26(PC5) ; port RS-485/232.TXD/RS485-3
USART5_RX: U2.28(PB1) ; port USART5_RX
USART5_TX: U2.27(PB0) ; port USART5_TX
USB_N: D3.1(K) J7.A7(D-) J7.B7(D-) U2.43(PA11[PA9])
USB_P: D4.1(K) J7.A6(D+) J7.B6(D+) U2.44(PA12[PA10])
NetC4_2: C4.2 R13.1 X1.1(OSC1)
NetC6_1: C6.1 R14.1 X1.4(OSC2)
NetC7_2: C7.2 R18.1 X2.1(OSC1)
NetC8_2: C8.2 J7.S1(SHELL) J7.S2(SHELL) J7.S3(SHELL) J7.S4(SHELL) R17.1
NetC11_2: C11.2 R19.1 X2.3(OSC2)
NetC12_2: C12.2 D6.1(K) L1.2 U2.7(VREF+)
NetC15_1: C15.1 FB5.1 R32.1 U4.8(VDD)
NetFB2_1: FB2.1 J7.A4/B9(VBUS) J7.B4/A9(VBUS)
NetFB2_2: FB2.2 R12.1
NetJ7_A5: J7.A5(CC1) R15.1
NetJ7_B5: J7.B5(CC2) R16.1
NetJ9_1: J9.1 R89.2
NetJ9_2: J9.2 R231.2
NetJ9_3: J9.3 R232.2
NetJ9_4: J9.4 R233.2
NetJ9_5: J9.5 R23.2
NetJ9_6: J9.6 R24.2
NetJ9_7: J9.7 R26.2
NetJ9_8: J9.8 R27.2
NetJ9_9: J9.9 R28.2
NetJ9_10: J9.10 R29.2
NetJ9_11: J9.11 R30.2
NetJ9_12: J9.12 R31.2
NetJ10_1: J10.1 R25.1
NetJ12_2: J12.2 R37.2
NetJ12_3: J12.3 R38.2
NetLED6_2: LED6.2 R236.2
NetLED9_2: LED9.2 R237.2
NetLED10_2: LED10.2 R238.2
NetLED11_2: LED11.2 R239.2
NetR33_1: R33.1 U3.20(INTA)
NetR35_1: R35.1 U3.18(~{RESET})
NetR36_2: R36.2 U3.15(A0)
NetR234_2: R234.2 U3.16(A1)
NetR235_2: R235.2 U3.17(A2)
NetR236_1: R236.1 U3.25(GPA4)
NetR237_1: R237.1 U3.26(GPA5)
NetR238_1: R238.1 U3.27(GPA6)
NetR239_1: R239.1 U3.28(GPA7)

Not connected (* = marked no-connect by the designer): J7 A8(SBU1)* B8(SBU2)*; U3 11(NC)* 14(NC)*; U4 6(AIN2) 7(AIN3)

### Layout directives
differential pair; net class USB_PROGRAM; differential pair class USB_PROGRAM_LINES; rule Impedance Constraint [Min = 85.00    Max = 90.00    ]; rule Matched Net Lengths [Tolerance = 50mil]: USB_N, USB_P

### Notes on the sheet
- (near C4) 6.8pF
- (near R13) 0R
- 32.768kHz
- (near C6) 6.8pF
- (near R14) 0R
- USART6
- USART2
- USART4
- USART1
- USART3
- USART5
- REED SW
- ANALOG
- File:
- Title:
- Date:
- Page
- Num:
- Total:
- Drawn By: Huzaifa Ali